# Altium schematic sheet Power_management(1).SchDoc: =DT_SCH_Title
size A3; Organization: Droid Technologies; SheetNumber: 15; SheetTotal: 16
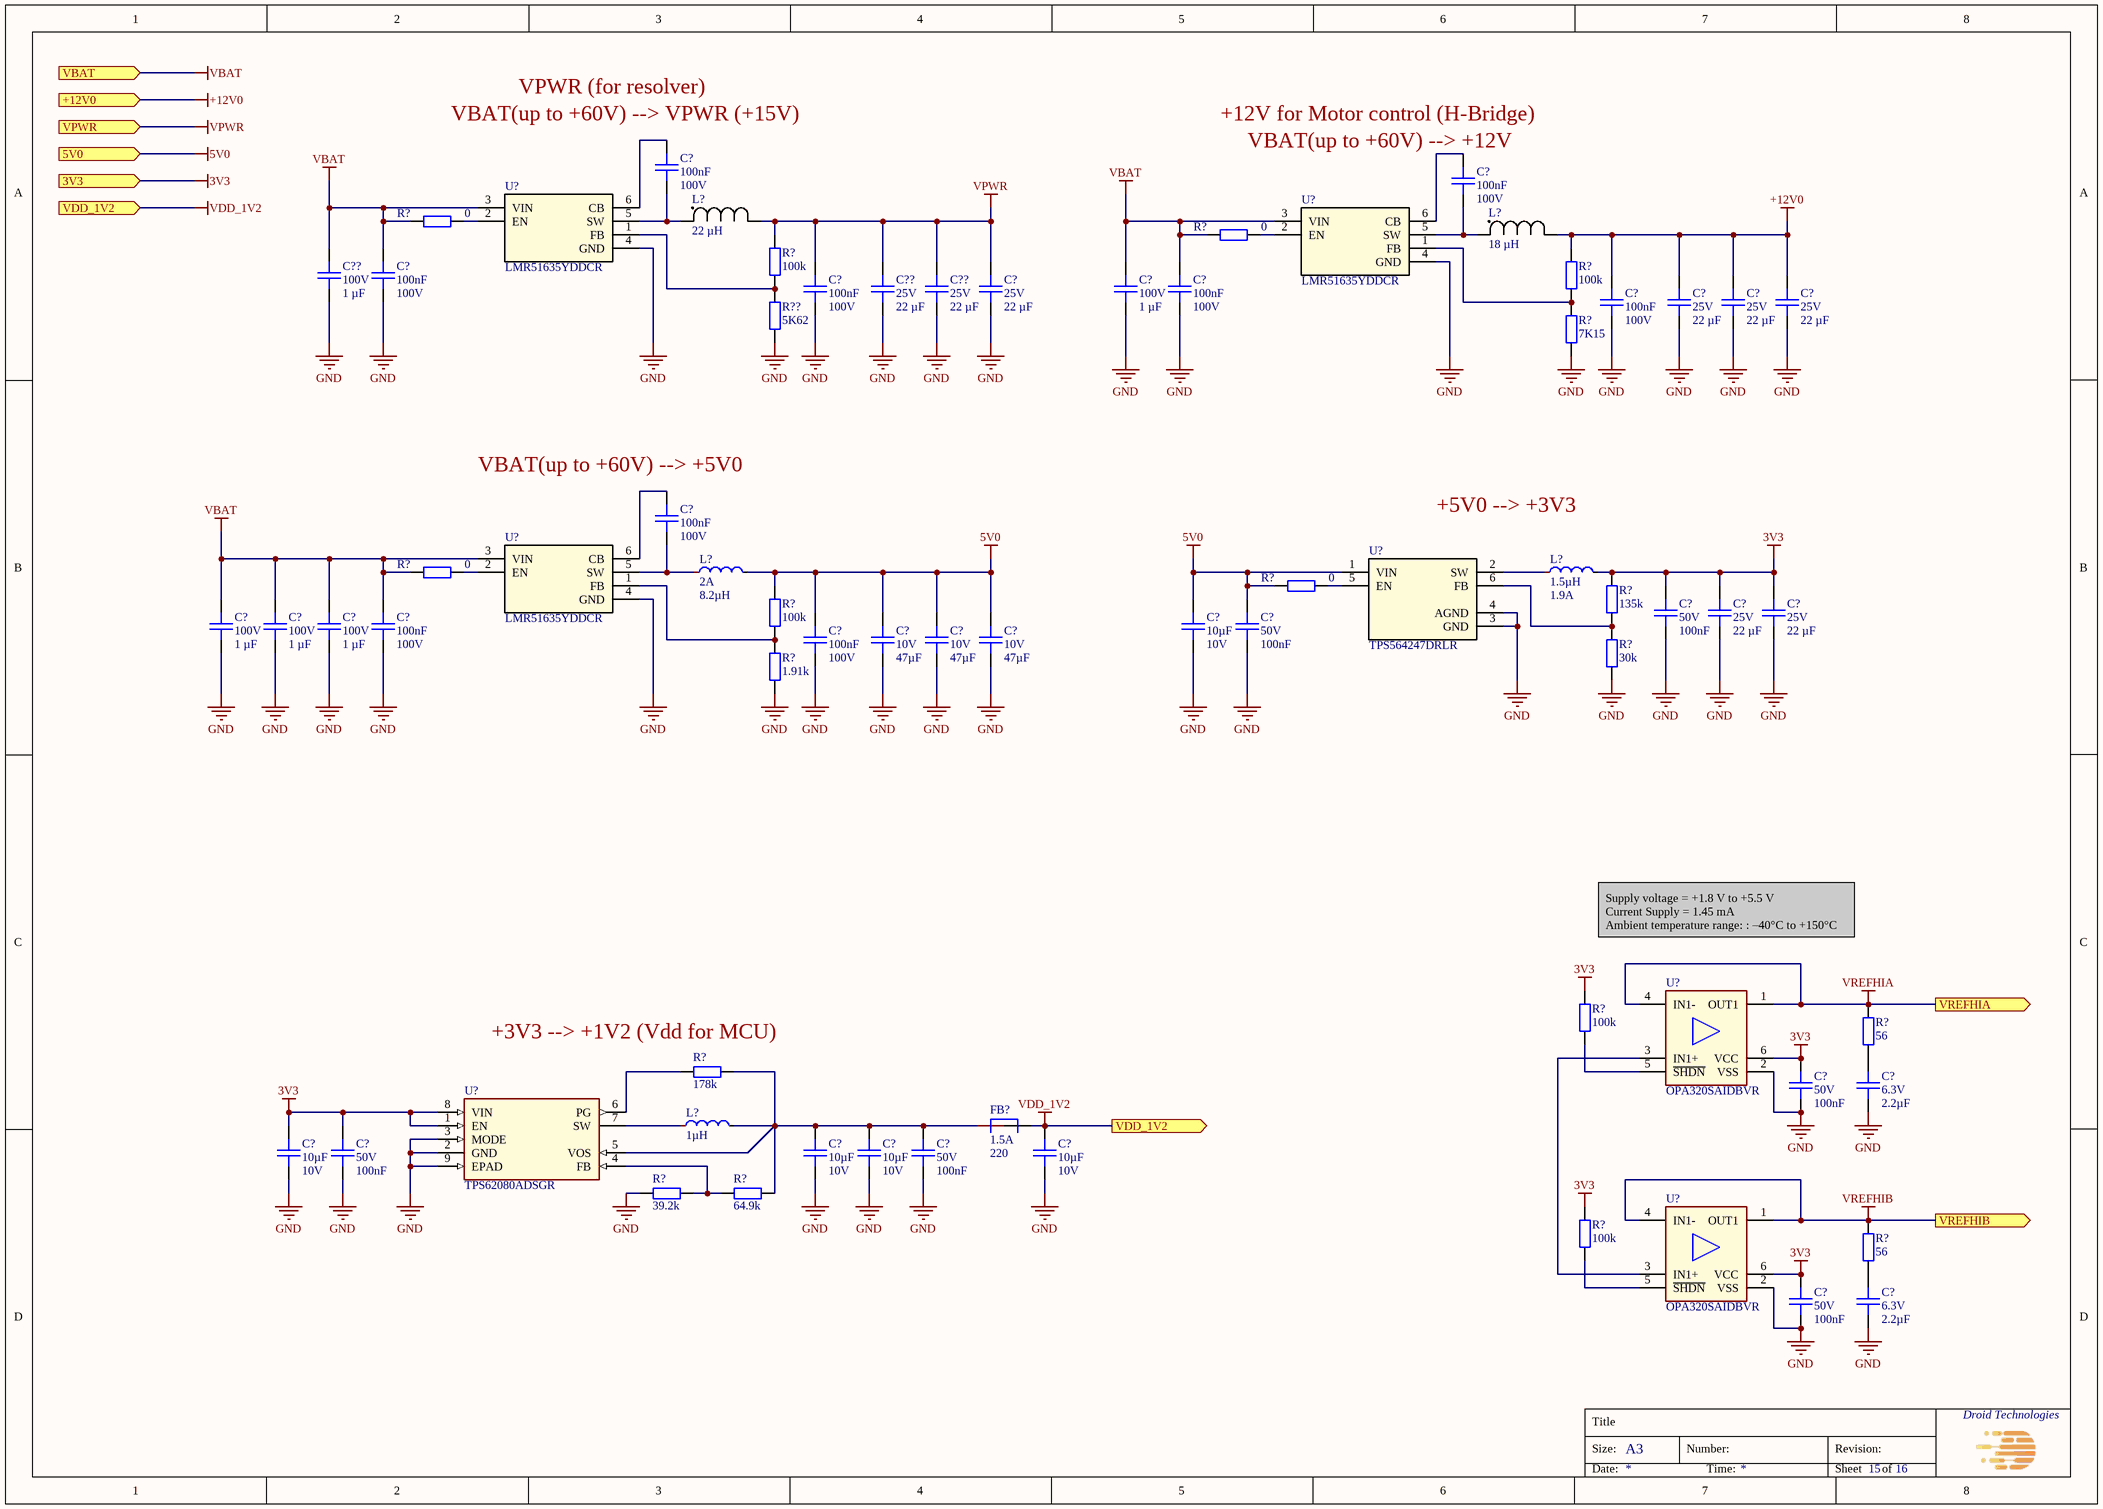
[diagram p0: Power_management(1).SchDoc]

## Parts
(Parts that share a designator on the sheet are numbered #1, #2 ... from top to bottom, then left to right.)
C?#1  Capacitance: 100nF  Voltage Rating: 100V  [CAPC160X80X90L35]  (hidden comment: GCJ188L8EL104KA07D)
C?#2  Capacitance: 100nF  Voltage Rating: 100V  [CAPC160X80X90L35]  (hidden comment: GCJ188L8EL104KA07D)
C?#3  Capacitance: 100nF  Voltage Rating: 100V  [CAPC160X80X90L35]  (hidden comment: GCJ188L8EL104KA07D)
C?#4  Capacitance: 100nF  Voltage Rating: 100V  [CAPC160X80X90L35]  (hidden comment: GCJ188L8EL104KA07D)
C?#5  Voltage Rating: 25V  Capacitance: 22 µF  [CAPC3225X270N]  (hidden comment: CGA6P3X7R1E226M250AB)
C?#6  Voltage Rating: 100V  Capacitance: 1 µF  [CAP_08051A0R8CAT2A_AVX]  (hidden comment: 08051C105K4Z2A)
C?#7  Capacitance: 100nF  Voltage Rating: 100V  [CAPC160X80X90L35]  (hidden comment: GCJ188L8EL104KA07D)
C?#8  Capacitance: 100nF  Voltage Rating: 100V  [CAPC160X80X90L35]  (hidden comment: GCJ188L8EL104KA07D)
C?#9  Voltage Rating: 25V  Capacitance: 22 µF  [CAPC3225X270N]  (hidden comment: CGA6P3X7R1E226M250AB)
C?#10  Voltage Rating: 25V  Capacitance: 22 µF  [CAPC3225X270N]  (hidden comment: CGA6P3X7R1E226M250AB)
C?#11  Voltage Rating: 25V  Capacitance: 22 µF  [CAPC3225X270N]  (hidden comment: CGA6P3X7R1E226M250AB)
C?#12  Capacitance: 100nF  Voltage Rating: 100V  [CAPC160X80X90L35]  (hidden comment: GCJ188L8EL104KA07D)
C?#13  Voltage Rating: 50V  Capacitance: 100nF  [CAPC100x50x50L25]  (hidden comment: GCM155L8EH104KE07D)
C?#14  Voltage Rating: 25V  Capacitance: 22 µF  [CAPC3225X270N]  (hidden comment: CGA6P3X7R1E226M250AB)
C?#15  Voltage Rating: 25V  Capacitance: 22 µF  [CAPC3225X270N]  (hidden comment: CGA6P3X7R1E226M250AB)
C?#16  Voltage Rating: 100V  Capacitance: 1 µF  [CAP_08051A0R8CAT2A_AVX]  (hidden comment: 08051C105K4Z2A)
C?#17  Voltage Rating: 100V  Capacitance: 1 µF  [CAP_08051A0R8CAT2A_AVX]  (hidden comment: 08051C105K4Z2A)
C?#18  Voltage Rating: 100V  Capacitance: 1 µF  [CAP_08051A0R8CAT2A_AVX]  (hidden comment: 08051C105K4Z2A)
C?#19  Capacitance: 100nF  Voltage Rating: 100V  [CAPC160X80X90L35]  (hidden comment: GCJ188L8EL104KA07D)
C?#20  Capacitance: 10µF  Voltage Rating: 10V  [CAPC200X125X145L50]  (hidden comment: CGA4J1X8L1A106K125AC)
C?#21  Voltage Rating: 50V  Capacitance: 100nF  [CAPC100x50x50L25]  (hidden comment: GCM155L8EH104KE07D)
C?#22  Capacitance: 100nF  Voltage Rating: 100V  [CAPC160X80X90L35]  (hidden comment: GCJ188L8EL104KA07D)
C?#23  Voltage Rating: 10V  Capacitance: 47µF  [CAPC200X125X145L50]  (hidden comment: GMC21X5R476M10NT)
C?#24  Voltage Rating: 10V  Capacitance: 47µF  [CAPC200X125X145L50]  (hidden comment: GMC21X5R476M10NT)
C?#25  Voltage Rating: 10V  Capacitance: 47µF  [CAPC200X125X145L50]  (hidden comment: GMC21X5R476M10NT)
C?#26  Voltage Rating: 50V  Capacitance: 100nF  [CAPC100x50x50L25]  (hidden comment: GCM155L8EH104KE07D)
C?#27  Voltage Rating: 6.3V  Capacitance: 2.2µF  [CAPC160X80X90L35]  (hidden comment: C1608X8L0J225K080AC)
C?#28  Capacitance: 10µF  Voltage Rating: 10V  [CAPC200X125X145L50]  (hidden comment: CGA4J1X8L1A106K125AC)
C?#29  Voltage Rating: 50V  Capacitance: 100nF  [CAPC100x50x50L25]  (hidden comment: GCM155L8EH104KE07D)
C?#30  Capacitance: 10µF  Voltage Rating: 10V  [CAPC200X125X145L50]  (hidden comment: CGA4J1X8L1A106K125AC)
C?#31  Capacitance: 10µF  Voltage Rating: 10V  [CAPC200X125X145L50]  (hidden comment: CGA4J1X8L1A106K125AC)
C?#32  Voltage Rating: 50V  Capacitance: 100nF  [CAPC100x50x50L25]  (hidden comment: GCM155L8EH104KE07D)
C?#33  Capacitance: 10µF  Voltage Rating: 10V  [CAPC200X125X145L50]  (hidden comment: CGA4J1X8L1A106K125AC)
C?#34  Voltage Rating: 50V  Capacitance: 100nF  [CAPC100x50x50L25]  (hidden comment: GCM155L8EH104KE07D)
C?#35  Voltage Rating: 6.3V  Capacitance: 2.2µF  [CAPC160X80X90L35]  (hidden comment: C1608X8L0J225K080AC)
C??#1  Voltage Rating: 100V  Capacitance: 1 µF  [CAP_08051A0R8CAT2A_AVX]  (hidden comment: 08051C105K4Z2A)
C??#2  Voltage Rating: 25V  Capacitance: 22 µF  [CAPC3225X270N]  (hidden comment: CGA6P3X7R1E226M250AB)
C??#3  Voltage Rating: 25V  Capacitance: 22 µF  [CAPC3225X270N]  (hidden comment: CGA6P3X7R1E226M250AB)
FB?  Imax: 1.5A  Impedance: 220  [BEADC160X80X95L40]  (hidden comment: BLM18KG221BH1D)
L?#1  Inductance: 22 µH  [WE-LQS_8040]  (hidden comment: 74404084220)
L?#2  Inductance: 18 µH  [WE-LQS_8040]  (hidden comment: 74404084180)
L?#3  I: 2A  Inductance: 8.2µH  [BOURNS_SRP4020TA]  (hidden comment: SRP4020TA-8R2M)
L?#4  Inductance: 1.5µH  I: 1.9A  [TDK_VLS201612]  (hidden comment: VLS201612CX-1R5M-1)
L?#5  Inductance: 1µH  [INDC250X200X120L60]  (hidden comment: DFE2HCAH1R0MJ0L)
R?#1  Resistance: 0  [RESC160X80X55L30]  (hidden comment: RC0603FR-070RL)
R?#2  Resistance: 0  [RESC160X80X55L30]  (hidden comment: RC0603FR-070RL)
R?#3  Resistance: 100k  [RESC100X50X40L25]  (hidden comment: RC0402FR-07100KL)
R?#4  Resistance: 100k  [RESC100X50X40L25]  (hidden comment: RC0402FR-07100KL)
R?#5  Resistance: 7K15  [RC0402N_PAN]  (hidden comment: ERJ-2RKF7151X)
R?#6  Resistance: 0  [RESC160X80X55L30]  (hidden comment: RC0603FR-070RL)
R?#7  Resistance: 0  [RESC160X80X55L30]  (hidden comment: RC0603FR-070RL)
R?#8  Resistance: 135k  [RESC100X50X40L25]  (hidden comment: RN73H1ETTP1353F50)
R?#9  Resistance: 100k  [RESC100X50X40L25]  (hidden comment: RC0402FR-07100KL)
R?#10  Resistance: 30k  [RESC100X50X40L25]  (hidden comment: RC0402FR-0730KL)
R?#11  Resistance: 1.91k  [RESC100X50X40L25]  (hidden comment: RC0402FR-071K91L)
R?#12  Resistance: 100k  [RESC100X50X40L25]  (hidden comment: RC0402FR-07100KL)
R?#13  Resistance: 56  [RESC100X50X40L25]  (hidden comment: RC0402FR-0756RL)
R?#14  Resistance: 178k  [RESC100X50X40L25]  (hidden comment: RC0402FR-07178KL)
R?#15  Resistance: 39.2k  [RESC100X50X40L25]  (hidden comment: RMCF0402FT39K2)
R?#16  Resistance: 64.9k  [RESC100X50X40L25]  (hidden comment: RC0402FR-0764K9L)
R?#17  Resistance: 100k  [RESC100X50X40L25]  (hidden comment: RC0402FR-07100KL)
R?#18  Resistance: 56  [RESC100X50X40L25]  (hidden comment: RC0402FR-0756RL)
R??  Resistance: 5K62  [RC0402N_PAN]  (hidden comment: ERJ-2RKF5621X)
U?#1  LMR51635YDDCR  [DDC0006A-MFG]
U?#2  LMR51635YDDCR  [DDC0006A-MFG]
U?#3  LMR51635YDDCR  [DDC0006A-MFG]
U?#4  TPS564247DRLR  [SOT5x3-6_DRL_TEX]
U?#5  OPA320SAIDBVR  [SOT-23-6]
U?#6  TPS62080ADSGR  [WSON (8) 2*2mm]
U?#7  OPA320SAIDBVR  [SOT-23-6]

## Ports
3V3 (in), 5V0 (in), +12V0 (in), VBAT (in), VDD_1V2 (in), VDD_1V2 (out), VPWR (in), VREFHIA (out), VREFHIB (out)

## Nets
3V3: C?#13.2 C?#14.2 C?#15.2 C?#26.2 C?#28.2 C?#29.2 C?#34.2 L?#4.2 R?#8.2 R?#12.2 R?#17.2 U?#5.6(VCC) U?#6.1(EN) U?#6.8(VIN) U?#7.6(VCC) ; port 3V3
5V0: C?#20.2 C?#21.2 C?#22.2 C?#23.2 C?#24.2 C?#25.2 L?#3.2 R?#7.1 R?#9.2 U?#4.1(VIN) ; port 5V0
+12V0: C?#8.2 C?#9.2 C?#10.2 C?#11.2 L?#2.2 R?#4.2 ; port +12V0
GND: C?#3.1 C?#4.1 C?#5.1 C?#6.1 C?#7.1 C?#8.1 C?#9.1 C?#10.1 C?#11.1 C?#13.1 C?#14.1 C?#15.1 C?#16.1 C?#17.1 C?#18.1 C?#19.1 C?#20.1 C?#21.1 C?#22.1 C?#23.1 C?#24.1 C?#25.1 C?#26.1 C?#27.1 C?#28.1 C?#29.1 C?#30.1 C?#31.1 C?#32.1 C?#33.1 C?#34.1 C?#35.1 C??#1.1 C??#2.1 C??#3.1 R?#5.1 R?#10.1 R?#11.1 R?#15.1 R??.1 U?#1.4(GND) U?#2.4(GND) U?#3.4(GND) U?#4.3(GND) U?#4.4(AGND) U?#5.2(VSS) U?#6.2(GND) U?#6.3(MODE) U?#6.9(EPAD) U?#7.2(VSS)
VBAT: C?#3.2 C?#6.2 C?#7.2 C?#16.2 C?#17.2 C?#18.2 C?#19.2 C??#1.2 R?#1.1 R?#2.1 R?#6.1 U?#1.3(VIN) U?#2.3(VIN) U?#3.3(VIN) ; port VBAT
VDD_1V2: C?#33.2 FB?.2 ; port VDD_1V2
VPWR: C?#4.2 C?#5.2 C??#2.2 C??#3.2 L?#1.2 R?#3.2 ; port VPWR
VREFHIA: R?#13.2 U?#5.1(OUT1) U?#5.4(IN1-) ; port VREFHIA
VREFHIB: R?#18.2 U?#7.1(OUT1) U?#7.4(IN1-) ; port VREFHIB
NetC?#1_1: C?#1.1 L?#1.1 U?#1.5(SW)
NetC?#1_2: C?#1.2 U?#1.6(CB)
NetC?#2_1: C?#2.1 L?#2.1 U?#2.5(SW)
NetC?#2_2: C?#2.2 U?#2.6(CB)
NetC?#12_1: C?#12.1 L?#3.1 U?#3.5(SW)
NetC?#12_2: C?#12.2 U?#3.6(CB)
NetC?#27_2: C?#27.2 R?#13.1
NetC?#30_2: C?#30.2 C?#31.2 C?#32.2 FB?.1 L?#5.2 R?#14.2 R?#16.2 U?#6.5(VOS)
NetC?#35_2: C?#35.2 R?#18.1
NetL?#4_1: L?#4.1 U?#4.2(SW)
NetL?#5_1: L?#5.1 U?#6.7(SW)
NetR?#1_2: R?#1.2 U?#1.2(EN)
NetR?#2_2: R?#2.2 U?#2.2(EN)
NetR?#3_1: R?#3.1 R??.2 U?#1.1(FB)
NetR?#4_1: R?#4.1 R?#5.2 U?#2.1(FB)
NetR?#6_2: R?#6.2 U?#3.2(EN)
NetR?#7_2: R?#7.2 U?#4.5(EN)
NetR?#8_1: R?#8.1 R?#10.2 U?#4.6(FB)
NetR?#9_1: R?#9.1 R?#11.2 U?#3.1(FB)
NetR?#12_1: R?#12.1 U?#5.5(~{SHDN})
NetR?#14_1: R?#14.1 U?#6.6(PG)
NetR?#15_2: R?#15.2 R?#16.1 U?#6.4(FB)
NetR?#17_1: R?#17.1 U?#7.5(~{SHDN})
NetU?#5_3: U?#5.3(IN1+) U?#7.3(IN1+)

## Notes on the sheet
- (near C?#1) VBAT(up to +60V) --> VPWR (+15V)
- VPWR (for resolver)
- (near C?#2) +12V for Motor control (H-Bridge)
- (near C?#2) VBAT(up to +60V) --> +12V
- (near C?#12) VBAT(up to +60V) --> +5V0
- +5V0 --> +3V3
- Supply voltage = +1.8 V to +5.5 V
  Current Supply = 1.45 mA
  Ambient temperature range: : –40°C to +150°C
- (near R?#14) +3V3 --> +1V2 (Vdd for MCU)
- Title
- Size:
- A3
- Number:
- Revision:
- Date:
- Time:
- Sheet
- of

## Library data of the parts
C?#1-C?#4 C?#7 C?#8 C?#12 C?#19 C?#22 = CMP-001-2003-1: CAP CER 0.1UF 100V X8L 0603; Manufacturer: Murata Electronics; Tolerance: 10%; Op Temp min: -55°C; Op Temp max: 150°C; Package: 0603 (1608 Metric); ComponentLink3URL: https://www.digikey.com/en/products/detail/murata-electronics/GCJ188L8EL104KA07D/11618648; Lead Spacing: 0mm; ComponentLink1Description: Datasheet; ComponentLink1URL: https://www.murata.com/en-sg/api/pdfdownloadapi?cate=luCeramicCapacitorsSMD&partno=GCJ188L8EL104KA07%23; ComponentLink3Description: Digikey; MPN: GCJ188L8EL104KA07D; Ratings: AEC-Q200; ComponentLink2Description: Mouser; Height max: 900µm; Dielectric: X8L; Mounting Type: SM; ComponentLink2URL: https://eu.mouser.com/ProductDetail/Murata-Electronics/GCJ188L8EL104KA07D?qs=rrS6PyfT74fTpbPMbkPm2A%3D%3D; Size: 1.60mm x 0.80mm
C?#5 C?#9-C?#11 C?#14 C?#15 C??#2 C??#3 = CAP_1210_CGA6P3X7R1E226M250AB: CAP CER 22UF 25V X7R 1210; Manufacturer: TDK Corporation; Op Temp max: 125°C; Op Temp min: -55°C; Tolerance: ±20%; ComponentLink3URL: https://www.digikey.at/en/products/detail/tdk-corporation/CGA6P3X7R1E226M250AB/9555472; MPN: CGA6P3X7R1E226M250AB; ComponentLink1URL: https://product.tdk.com/system/files/dam/doc/product/capacitor/ceramic/mlcc/catalog/mlcc_automotive_general_en.pdf; Package: 1210 (3225 Metric); Size: 3.20mm x 2.50mm; Height max: 2.80mm; Mounting Type: SM; ComponentLink1Description: Datasheet; ComponentLink3Description: Digikey; Ratings: AEC-Q200; Dielectric: X7R; Lead Spacing: -; Component Type: Ceramic Capacitor; ComponentLink4Description: Mouser; ComponentLink4URL: https://eu.mouser.com/ProductDetail/TDK/CGA6P3X7R1E226M250AB?qs=w%2Fv1CP2dgqrKXzeuDypldA%3D%3D
C?#6 C?#16-C?#18 C??#1 = CAP_0805_08051C105K4Z2A: CAP CER 1UF 100V X7R 0805; Manufacturer: KYOCERA AVX; Op Temp min: -55°C; Op Temp max: 125°C; Tolerance: ±10%; ComponentLink3URL: https://www.digikey.at/en/products/detail/kyocera-avx/08051C105K4Z2A/9374704; ComponentLink1Description: Datasheet; MPN: 08051C105K4Z2A; Lead Spacing: -; ComponentLink2Description: Mouser; Ratings: AEC-Q200; Size: 2.01mm x 1.25mm; ComponentLink1URL: https://mm.digikey.com/Volume0/opasdata/d220001/medias/docus/6397/AutoMLCC-2952695-DS.pdf; Package: 0805 (2012 Metric); Dielectric: X7R; ComponentLink3Description: Digikey; ComponentLink2URL: https://eu.mouser.com/ProductDetail/KYOCERA-AVX/08051C105K4Z2A?qs=BZBei1rCqCB2WSMz8IvwsA%3D%3D; Height max: 900µm; Mounting Type: SM; Component Type: Ceramic Capacitor
C?#13 C?#21 C?#26 C?#29 C?#32 C?#34 = CMP-001-1980-1: CAP CER 0.1UF 50V X8L 0402; Manufacturer: Murata Electronics; Op Temp max: 150°C; Op Temp min: -55°C; Tolerance: 10%; Height max: 550µm; ComponentLink3Description: Digikey; Mounting Type: SM; ComponentLink3URL: https://www.digikey.com/en/products/detail/murata-electronics/GCM155L8EH104KE07D/11618823; Package: 0402 (1005 Metric); Lead Spacing: 0mm; MPN: GCM155L8EH104KE07D; Size: 1.00mm x 0.50mm; Ratings: AEC-Q200; ComponentLink1URL: https://search.murata.co.jp/Ceramy/image/img/A01X/G101/ENG/GCM155L8EH104KE07-01.pdf; ComponentLink1Description: Datasheet; Dielectric: X8L; ComponentLink2Description: Mouser; ComponentLink2URL: https://eu.mouser.com/ProductDetail/Murata-Electronics/GCM155L8EH104KE07D?qs=1mbolxNpo8fQSHf0HYnZWw%3D%3D
C?#20 C?#28 C?#30 C?#31 C?#33 = CMP-001-1984-1: CAP CER 10UF 10V X8L 0805; Manufacturer: TDK Corporation; Tolerance: 10%; Op Temp min: -55°C; Op Temp max: 150°C; ComponentLink3Description: Digikey; Mounting Type: SM; Ratings: AEC-Q200; ComponentLink1Description: Datasheet; ComponentLink3URL: https://www.digikey.com/en/products/detail/tdk-corporation/CGA4J1X8L1A106K125AC/9991388; Lead Spacing: 0mm; MPN: CGA4J1X8L1A106K125AC; Size: 2.00mm x 1.25mm; Height max: 1.5mm; ComponentLink2URL: https://eu.mouser.com/ProductDetail/TDK/CGA4J1X8L1A106K125AC?qs=gZXFycFWdANzH%252B2UvJJjtQ%3D%3D; Package: 0805 (2012 Metric); ComponentLink2Description: Mouser; Dielectric: X8L; ComponentLink1URL: https://product.tdk.com/system/files/dam/doc/product/capacitor/ceramic/mlcc/catalog/mlcc_automotive_hightemp_en.pdf
C?#23-C?#25 = CMP-00446-4: CAP CER 47UF 10V X5R 0805; Manufacturer: CAL-CHIP ELECTRONICS, INC.; Op Temp max: 85°C; Tolerance: 20%; Op Temp min: -55°C; Mounting Type: SM; ComponentLink2Description: Mouser; Dielectric: X5R; ComponentLink3URL: https://www.digikey.com/en/products/detail/cal-chip-electronics-inc/GMC21X5R476M10NT/12698064; ComponentLink1URL: http://www.calchipelectronics.com/pdf/gmc_series.pdf; Height max: 1.5mm; ComponentLink2URL: -; Package: 0805 (2012 Metric); Lead Spacing: 0mm; ComponentLink1Description: Datasheet; MPN: GMC21X5R476M10NT; ComponentLink3Description: Digikey; Ratings: -; Size: 2.00mm x 1.25mm
C?#27 C?#35 = CMP-001-2044-1: CAP CER 2.2UF 6.3V X8L 0603; Manufacturer: TDK Corporation; Op Temp min: -55°C; Tolerance: 10%; Op Temp max: 150°C; ComponentLink1URL: https://product.tdk.com/en/search/capacitor/ceramic/mlcc/info?part_no=C1608X8L0J225K080AC; MPN: C1608X8L0J225K080AC; ComponentLink3URL: https://www.digikey.com/en/products/detail/tdk-corporation/C1608X8L0J225K080AC/8343784; ComponentLink1Description: Datasheet; Lead Spacing: 0mm; ComponentLink3Description: Digikey; Package: 0603 (1608 Metric); Height max: 900µm; Size: 1.60mm x 0.80mm; Dielectric: X8L; Ratings: -; Mounting Type: SM; ComponentLink2URL: https://eu.mouser.com/ProductDetail/TDK/C1608X8L0J225K080AC?qs=rrS6PyfT74dgREMaiAoT3Q%3D%3D; ComponentLink2Description: Mouser
FB? = CMP-001-1981-1: FERRITE BEAD 220 OHM 0603 1LN; Manufacturer: Murata Electronics; DCR: 50m; Op Temp min: -55°C; Frequency: 100MHz; Op Temp max: 150°C; Number of Lines: 1; Mounting Type: SM; Size: 1.60mm x 0.80mm; ComponentLink2URL: https://eu.mouser.com/ProductDetail/Murata-Electronics/BLM18KG221BH1D?qs=sJ5gq5MLFXpgEHYBdWUtkQ%3D%3D; ComponentLink1Description: Datasheet; ComponentLink1URL: https://www.murata.com/en-us/products/productdata/8798137286686/QNFA9129.pdf; Lead Spacing: 0mm; Ratings: AEC-Q200; ComponentLink3Description: Digikey; ComponentLink3URL: https://www.digikey.com/en/products/detail/murata-electronics/BLM18KG221BH1D/6156000; Height max: 950µm; Package: 0603 (1608 Metric); ComponentLink2Description: Mouser; MPN: BLM18KG221BH1D
L?#1 = IND_74404084220: FIXED IND 22UH 2.1A 69 MOHM SMD; Manufacturer: Würth Elektronik; Current - Saturation (Isat): 3.3A; Shielding: Shielded; DC Resistance (DCR): 69mOhm; Frequency - Self Resonant: 9.5MHz; Inductance Frequency - Test: 100 kHz; Type: Drum Core, Wirewound; Material - Core: Ferrite; Tolerance: ±20%; MPN: 74404084220; Current Rating (Amps): 2.1 A; ComponentLink1Description: DigiKey; ComponentLink1URL: https://www.digikey.at/en/products/detail/w%C3%BCrth-elektronik/74404084220/4865715; ComponentLink2Description: Datasheet; ComponentLink2URL: https://www.we-online.com/components/products/datasheet/74404084180.pdf; Mounting Type: SM; Ratings: AEC-Q200; Q @ Freq: -; ComponentLink3Description: Mouser; ComponentLink3URL: https://eu.mouser.com/ProductDetail/Wurth-Elektronik/74404084220?qs=Zt3UNFD9mQj6g2r9g%252BlaYA%3D%3D; Size / Dimension: 8.00mm x 8.00mm); Height - Seated (Max: 4.20mm
L?#2 = IND_74404084180: FIXED IND 18UH 2.4A 53 MOHM SMD; Manufacturer: Würth Elektronik; Current - Saturation (Isat): 3.2A; Shielding: Shielded; DC Resistance (DCR): 53mOhm; Frequency - Self Resonant: 16.5MHz; Inductance Frequency - Test: 100 kHz; Type: Drum Core, Wirewound; Material - Core: Ferrite; Tolerance: ±20%; MPN: 74404084180; Current Rating (Amps): 2.4 A; ComponentLink1Description: DigiKey; ComponentLink1URL: https://www.digikey.at/en/products/detail/w%C3%BCrth-elektronik/74404084180/4865714; ComponentLink2Description: Datasheet; ComponentLink2URL: https://www.we-online.com/components/products/datasheet/74404084180.pdf; Mounting Type: SM; Ratings: AEC-Q200; Q @ Freq: -; ComponentLink3Description: Mouser; ComponentLink3URL: https://eu.mouser.com/ProductDetail/Wurth-Elektronik/74404084180?qs=Zt3UNFD9mQi7%2FFsJHsfi3g%3D%3D; Size / Dimension: 8.00mm x 8.00mm); Height - Seated (Max: 4.20mm
L?#3 = CMP-00885-1: FIXED IND 8.2UH 2A 180 MOHM SMD; Manufacturer: Bourns Inc.; Type: Drum Core, Wirewound; Op Temp min: -40°C; Material - Core: Carbonyl Powder; DCR: 0.18; Op Temp max: 150°C; Tolerance: 20%; Isat: 2.5A; Fsr: 21MHz; Shielding: Shielded; Ratings: AEC-Q200; ComponentLink3Description: Digikey; ComponentLink2Description: Mouser; Height max: 2mm; Lead Spacing: 0mm; ComponentLink1Description: Datasheet; Package: 2-SMD; ComponentLink3URL: https://www.digikey.com/en/products/detail/bourns-inc/SRP4020TA-8R2M/4901009?s=N4IgTCBcDaIMoCUAKAWADGNAVAggWgA4EwBZEAXQF8g; ComponentLink2URL: https://eu.mouser.com/ProductDetail/Bourns/SRP4020TA-8R2M?qs=Ph8%2FHnX6CQwwXiBs8JjSfQ%3D%3D; Size: 4.45mm x 4.06mm; MPN: SRP4020TA-8R2M; ComponentLink1URL: https://www.bourns.com/docs/Product-Datasheets/SRP4020TA.pdf; Mounting Type: SM
L?#4 = CMP-00892-2: FIXED IND 1.5UH 1.9A 89MOHM SMD; Manufacturer: TDK Corporation; Op Temp max: 105°C; Shielding: Shielded; DCR: 89m; Type: Drum Core, Wirewound; Material - Core: Ferrite; Tolerance: 20%; Op Temp min: -40°C; Fsr: 0Hz; Isat: 1.62A; Height max: 1.2mm; Size: 2.00mm x 1.60mm; ComponentLink3URL: https://www.digikey.com/en/products/detail/tdk-corporation/VLS201612CX-1R5M-1/5169766; ComponentLink2Description: Mouser; ComponentLink1Description: Datasheet; Mounting Type: SM; Lead Spacing: 0mm; MPN: VLS201612CX-1R5M-1; ComponentLink3Description: Digikey; Package: Nonstandard; ComponentLink2URL: https://eu.mouser.com/ProductDetail/TDK/VLS201612CX-1R5M-1?qs=1mbolxNpo8ckwscKPJipMQ%3D%3D; Ratings: -; ComponentLink1URL: https://product.tdk.com/en/search/inductor/inductor/smd/info?part_no=VLS201612CX-1R5M-1&utm_source=inductor_commercial_power_vls201612cx-1_en.pdf&utm_medium=catalog
L?#5 = CMP-001-2041-1: FIXED IND 1UH 3A 50 MOHM SMD; Manufacturer: Murata Electronics; Fsr: 79MHz; Shielding: Shielded; Material - Core: Metal; DCR: 50m; Type: Drum Core, Wirewound; Op Temp min: -40°C; Isat: 3.4A; Tolerance: 20%; Op Temp max: 150°C; Height max: 1.2mm; I: 3A; ComponentLink1URL: https://www.murata.com/en-us/products/productdetail?partno=DFE2HCAH1R0MJ0%23; ComponentLink1Description: Datasheet; Lead Spacing: 0mm; ComponentLink3URL: https://www.digikey.com/en/products/detail/murata-electronics/DFE2HCAH1R0MJ0L/10135180; ComponentLink2URL: https://eu.mouser.com/ProductDetail/Murata-Electronics/DFE2HCAH1R0MJ0L?qs=17u8i%2FzlE8%2FsfvqDr48AMQ%3D%3D; Ratings: AEC-Q200; ComponentLink3Description: Digikey; Package: 1008 (2520 Metric); ComponentLink2Description: Mouser; MPN: DFE2HCAH1R0MJ0L; Size: 2.50mm x 2.00mm; Mounting Type: SM
R?#1 R?#2 R?#6 R?#7 = CMP-001-0927-2: RES 0 OHM JUMPER 1/10W 0603; Manufacturer: YAGEO; Op Temp min: -55°C; Op Temp max: 155°C; Power: 100mW; Tolerance: 0%; Height max: 550µm; ComponentLink2URL: https://eu.mouser.com/ProductDetail/YAGEO/RC0603FR-070RL?qs=0yPvnVz5%2FmpDQv43TwvCfw%3D%3D; Temperature Coefficient: -; ComponentLink3Description: Digikey; ComponentLink2Description: Mouser; MPN: RC0603FR-070RL; ComponentLink1URL: https://www.yageo.com/upload/media/product/productsearch/datasheet/rchip/PYu-RC_Group_51_RoHS_L_12.pdf; Ratings: -; Size: 1.60mm x 0.80mm; Composition: Thick Film; Mounting Type: SM; ComponentLink3URL: https://www.digikey.com/en/products/detail/yageo/RC0603FR-070RL/1304008; Package: 0603 (1608 Metric); ComponentLink1Description: Datasheet
R?#3 R?#4 R?#9 R?#12 R?#17 = CMP-00121-6: RES 100K OHM 1% 1/16W 0402; Manufacturer: YAGEO; Op Temp min: -55°C; Op Temp max: 155°C; Power: 63mW; Temperature Coefficient: ±100ppm; ComponentLink2Description: Mouser; Mounting Type: SM; Composition: Thick Film; ComponentLink3URL: https://www.digikey.com/en/products/detail/yageo/RC0402FR-07100KL/726526; Size: 1.00mm x 0.50mm; MPN: RC0402FR-07100KL; Tolerance: 1%; Ratings: -; ComponentLink1Description: Datasheet; ComponentLink2URL: https://eu.mouser.com/ProductDetail/YAGEO/RC0402FR-07100KL?qs=%2Fha2pyFaduhjtLcYvKXQ8IUndG0u%252BuCx1gxMxvN%252Btd7iB7mgHWsSbw%3D%3D; Package: 0402 (1005 Metric); ComponentLink1URL: https://www.yageo.com/upload/media/product/productsearch/datasheet/rchip/PYu-RC_Group_51_RoHS_L_12.pdf; ComponentLink3Description: Digikey; Height max: 400µm
R?#5 = RC_0402_ERJ-2RKF7151X: RES SMD 7.15K OHM 1% 1/10W 0402; Manufacturer: Panasonic Electronic Components; Temperature Coefficient: ±100ppm/°C; Power: 0.1W, 1/10W; Op Temp min: -55°C; Op Temp max: 155°C; Ratings: Automotive AEC-Q200; Package: 0402 (1005 Metric); MPN: ERJ-2RKF7151X; Size: 1.00mm x 0.50mm; ComponentLink1Description: Datasheet; ComponentLink3Description: Digikey; ComponentLink2URL: https://eu.mouser.com/ProductDetail/Panasonic/ERJ-2RKF7151X?qs=iBwFsHVUAOeT%2FIodbHv05A%3D%3D; Mounting Type: SM; Composition: Thick Film; ComponentLink3URL: https://www.digikey.at/en/products/detail/panasonic-electronic-components/ERJ-2RKF7151X/192455?s=N4IgTCBcDaIKICUBSBaMCDSAxA7ARgFY8ANEAXQF8g; Tolerance: 1%; Height max: 0.40mm; ComponentLink2Description: Mouser; ComponentLink1URL: https://industrial.panasonic.com/cdbs/www-data/pdf/RDA0000/AOA0000C304.pdf; Component Type: Chip Resistor
R?#8 = CMP-001-0382-5: RES 135K OHM 1% 1/16W 0402; Manufacturer: KOA Speer Electronics, Inc.; Power: 63mW; Ratings: Automotive AEC-Q200, Moisture Resistant; Op Temp max: 155°C; Temperature Coefficient: ±100ppm; Op Temp min: -55°C; ComponentLink2URL: https://www.koaspeer.com/pdfs/RN73H.pdf; ComponentLink2Description: Mouser; Height max: 400µm; ComponentLink3Description: Digikey; Mounting Type: SM; Composition: Thick Film; Size: 1.00mm x 0.50mm; ComponentLink1URL: https://www.yageo.com/upload/media/product/productsearch/datasheet/rchip/PYu-RC_Group_51_RoHS_L_12.pdf; Tolerance: 1%; ComponentLink1Description: Datasheet; Package: 0402 (1005 Metric); ComponentLink3URL: https://www.digikey.at/en/products/detail/koa-speer-electronics-inc/RN73H1ETTP1353F50/9914841; MPN: RN73H1ETTP1353F50
R?#10 = CMP-001-0510-4: RES 30K OHM 1% 1/16W 0402; Manufacturer: YAGEO; Op Temp max: 155°C; Temperature Coefficient: ±100ppm; Power: 63mW; Op Temp min: -55°C; Tolerance: 1%; Composition: Thick Film; MPN: RC0402FR-0730KL; ComponentLink3Description: Digikey; Package: 0402 (1005 Metric); Size: 1.00mm x 0.50mm; Ratings: -; Mounting Type: SM; ComponentLink2Description: Mouser; ComponentLink3URL: https://www.digikey.com/en/products/detail/yageo/RC0402FR-0730KL/726586; ComponentLink1URL: https://www.yageo.com/upload/media/product/productsearch/datasheet/rchip/PYu-RC_Group_51_RoHS_L_12.pdf; Height max: 400µm; ComponentLink1Description: Datasheet; ComponentLink2URL: https://eu.mouser.com/ProductDetail/YAGEO/RC0402FR-0730KL?qs=YUgVZYePFqD%252BaGg4iT%252Br5g%3D%3D
R?#11 = CMP-00419-6: RES 1.91K OHM 1% 1/16W 0402; Manufacturer: YAGEO; Op Temp min: -55°C; Temperature Coefficient: ±100ppm; Op Temp max: 155°C; Power: 63mW; ComponentLink2Description: Mouser; ComponentLink1URL: https://www.yageo.com/upload/media/product/productsearch/datasheet/rchip/PYu-RC_Group_51_RoHS_L_12.pdf; ComponentLink3Description: Digikey; Composition: Thick Film; Tolerance: 1%; Ratings: -; Package: 0402 (1005 Metric); Mounting Type: SM; ComponentLink2URL: https://eu.mouser.com/ProductDetail/YAGEO/RC0402FR-071K91L?qs=%2Fha2pyFaduhjtLcYvKXQ8Exvf7RdQuNEJrJL9EjAZgPVltTSbbI12w%3D%3D; MPN: RC0402FR-071K91L; Height max: 400µm; ComponentLink3URL: https://www.digikey.com/en/products/detail/yageo/RC0402FR-071K91L/5280909; Size: 1.00mm x 0.50mm; ComponentLink1Description: Datasheet
R?#13 R?#18 = CMP-001-0492-6: RES 56 OHM 1% 1/16W 0402; Manufacturer: YAGEO; Op Temp min: -55°C; Temperature Coefficient: ±100ppm; Power: 63mW; Op Temp max: 155°C; Size: 1.00mm x 0.50mm; Mounting Type: SM; Height max: 400mm; ComponentLink3Description: Digikey; Tolerance: 1%; Ratings: -; MPN: RC0402FR-0756RL; ComponentLink1URL: https://www.yageo.com/upload/media/product/productsearch/datasheet/rchip/PYu-RC_Group_51_RoHS_L_12.pdf; ComponentLink3URL: https://www.digikey.com/en/products/detail/yageo/RC0402FR-0756RL/726636; ComponentLink2Description: Mouser; Composition: Thick Film; ComponentLink2URL: https://eu.mouser.com/ProductDetail/YAGEO/RC0402FR-0756RL?qs=V1yeUXFNrkmJal7VE1rFjw%3D%3D; ComponentLink1Description: Datasheet; Package: 0402 (1005 Metric)
R?#14 = CMP-00630-3: RES 178K OHM 1% 1/16W 0402; Manufacturer: YAGEO; Temperature Coefficient: ±100ppm; Power: 63mW; Op Temp min: -55°C; Op Temp max: 155°C; Size: 1.00mm x 0.50mm; Composition: Thick Film; ComponentLink3URL: https://www.digikey.com/en/products/detail/yageo/RC0402FR-07178KL/5280870?s=N4IgTCBcDaIEoGEAMAWJYBicC0SDsAjHgBwDSAMiALoC%2BQA; Tolerance: 1%; Package: 0402 (1005 Metric); ComponentLink3Description: Digikey; ComponentLink1Description: Datasheet; MPN: RC0402FR-07178KL; Mounting Type: SM; Ratings: -; ComponentLink1URL: https://www.yageo.com/upload/media/product/productsearch/datasheet/rchip/PYu-RC_Group_51_RoHS_L_12.pdf; ComponentLink2URL: https://eu.mouser.com/ProductDetail/YAGEO/RC0402FR-07178KL?qs=UOUeRUa%252B8WmEoK18p4ojZQ%3D%3D; Height max: 400µm; ComponentLink2Description: Mouser
R?#15 = CMP-001-2043-1: RES 39.2K OHM 1% 1/16W 0402; Manufacturer: Stackpole Electronics Inc; Op Temp min: -55°C; Temperature Coefficient: ±100ppm; Power: 63mW; Op Temp max: 155°C; ComponentLink1Description: Datasheet; Composition: Thick Film; ComponentLink1URL: https://www.seielect.com/catalog/sei-rmcf_rmcp.pdf; Package: 0402 (1005 Metric); ComponentLink3Description: Digikey; Tolerance: 1%; ComponentLink2Description: Mouser; MPN: RMCF0402FT39K2; Height max: 400µm; Ratings: AEC-Q200; ComponentLink2URL: https://eu.mouser.com/ProductDetail/SEI-Stackpole/RMCF0402FT39K2?qs=IPgv5n7u5QZ19xDSJPwVdQ%3D%3D; ComponentLink3URL: https://www.digikey.com/en/products/detail/stackpole-electronics-inc/RMCF0402FT39K2/1761390; Mounting Type: SM; Size: 1.00mm x 0.50mm
R?#16 = CMP-00721-2: RES 64.9K OHM 1% 1/16W 0402; Manufacturer: YAGEO; Temperature Coefficient: ±100ppm; Op Temp min: -55°C; Power: 63mW; Op Temp max: 155°C; Tolerance: 1%; Package: 0402 (1005 Metric); ComponentLink2URL: https://eu.mouser.com/ProductDetail/YAGEO/RC0402FR-0764K9L?qs=Is6ZsIPfHkbVUkOpst8WdA%3D%3D; MPN: RC0402FR-0764K9L; ComponentLink1URL: https://www.yageo.com/upload/media/product/productsearch/datasheet/rchip/PYu-RC_Group_51_RoHS_L_12.pdf; ComponentLink2Description: Mouser; ComponentLink3Description: Digikey; ComponentLink3URL: https://www.digikey.com/en/products/detail/yageo/RC0402FR-0764K9L/726649?s=N4IgTCBcDaIEoGEAMAWJYBicC0SDsAbCgNICcAMiALoC%2BQA; Composition: Thick Film; ComponentLink1Description: Datasheet; Mounting Type: SM; Ratings: -; Size: 1.00mm x 0.50mm; Height max: 400µm
R?? = RC_0402_ERJ-2RKF5621X: RES SMD 5.62K OHM 1% 1/10W 0402; Manufacturer: Panasonic Electronic Components; Temperature Coefficient: ±100ppm/°C; Power: 0.1W, 1/10W; Op Temp min: -55°C; Op Temp max: 155°C; Ratings: Automotive AEC-Q200; Package: 0402 (1005 Metric); MPN: ERJ-2RKF5621X; Size: 1.00mm x 0.50mm; ComponentLink1Description: Datasheet; ComponentLink3Description: Digikey; ComponentLink2URL: https://eu.mouser.com/ProductDetail/Panasonic/ERJ-2RKF5621X?qs=YMBIwoNQYdVW%2FAKb0KIR9A%3D%3D; Mounting Type: SM; Composition: Thick Film; ComponentLink3URL: https://www.digikey.at/en/products/detail/panasonic-electronic-components/ERJ-2RKF5621X/192390?s=N4IgTCBcDaIKICUBSBaMCDSAxArANjAEYANEAXQF8g; Tolerance: 1%; Height max: 0.40mm; ComponentLink2Description: Mouser; ComponentLink1URL: https://industrial.panasonic.com/cdbs/www-data/pdf/RDA0000/AOA0000C304.pdf; Component Type: Chip Resistor
U?#1-U?#3 = LMR51635YDDCR: SIMPLE SWITCHER SYNCHRONOUS BUCK; Manufacturer: Texas Instruments; Function: Step-Down; Output Type: Adjustable; Voltage - Input (Min): 4.3V; Voltage - Input (Max): 60V; Voltage - Output (Min/Fixed): 0.8V; Voltage - Output (Max): 30V; Current - Output: 3.5A; Frequency - Switching: 1.1MHz; Synchronous Rectifier: Yes; MPN: LMR51635YDDCR; Topology: Buck; Operating Temperature (MIN): -40°C  (TJ); Operating Temperature (MAX): 150°C (TJ); Mounting Type: SM; Package / Case: SOT-23-6 Thin, TSOT-23-6; ComponentLink1Description: Datasheet; ComponentLink1URL: https://www.ti.com/lit/ds/symlink/lmr51625.pdf?ts=1742888310253&ref_url=https%253A%252F%252Fwww.ti.com%252Fsitesearch%252Fen-us%252Fdocs%252Funiversalsearch.tsp%253FlangPref%253Den-US%2526nr%253D3%2526searchTerm%253DLMR51625XDDCR; ComponentLink2Description: DigiKey; ComponentLink2URL: https://www.digikey.at/en/products/detail/texas-instruments/LMR51635YDDCR/25991362?s=N4IgTCBcDaIDIFkBKBWAjANgMwoJoBF8BhJEAXQF8g; ComponentLink3Description: Mouser; ComponentLink3URL: https://eu.mouser.com/ProductDetail/Texas-Instruments/LMR51635YDDCR?qs=efUn273yAhf6vdsp91a46w%3D%3D
U?#4 = TPS564247DRLR: IC REG BUCK ADJ 4A SOT563; Manufacturer: Texas Instruments; Function: Step-Down; Output Type: Adjustable; Voltage - Input (Min): 3V; Voltage - Input (Max): 16V; Voltage - Output (Min/Fixed): 0.6V; Voltage - Output (Max): 7V; Frequency - Switching: 1.2MHz; MPN: TPS564247DRLR; Topology: Buck; Current - Output: 4A; Operating Temperature (MIN): -40°C (TJ); Operating Temperature (MAX): 125°C (TJ); Mounting Type: SM; Package / Case: SOT-563, SOT-666; ComponentLink1Description: Datsheet; ComponentLink1URL: https://www.ti.com/lit/ds/symlink/tps564242.pdf?ts=1750029010480; ComponentLink2Description: DigiKey; ComponentLink2URL: https://www.digikey.at/en/products/detail/texas-instruments/TPS564247DRLR/16585672?s=N4IgTCBcDaICoAUDKBWAbAFjBg7CAugL5A; ComponentLink3Description: Mouser; ComponentLink3URL: https://eu.mouser.com/ProductDetail/Texas-Instruments/TPS564247DRLR?qs=tlsG%2FOw5FFiLH60bcMvlFQ%3D%3D
U?#5 U?#7 = OPA320SAIDBVR: CMOS Amplifier 1 Circuit Rail-to-Rail SOT-23-6; Manufacturer: Texas Instruments; MPN: OPA320SAIDBVR
U?#6 = TPS62080ADSGR: IC REG BUCK ADJ 1.2A 8WSON; Manufacturer: Texas Instruments; MPN: TPS62080ADSGR